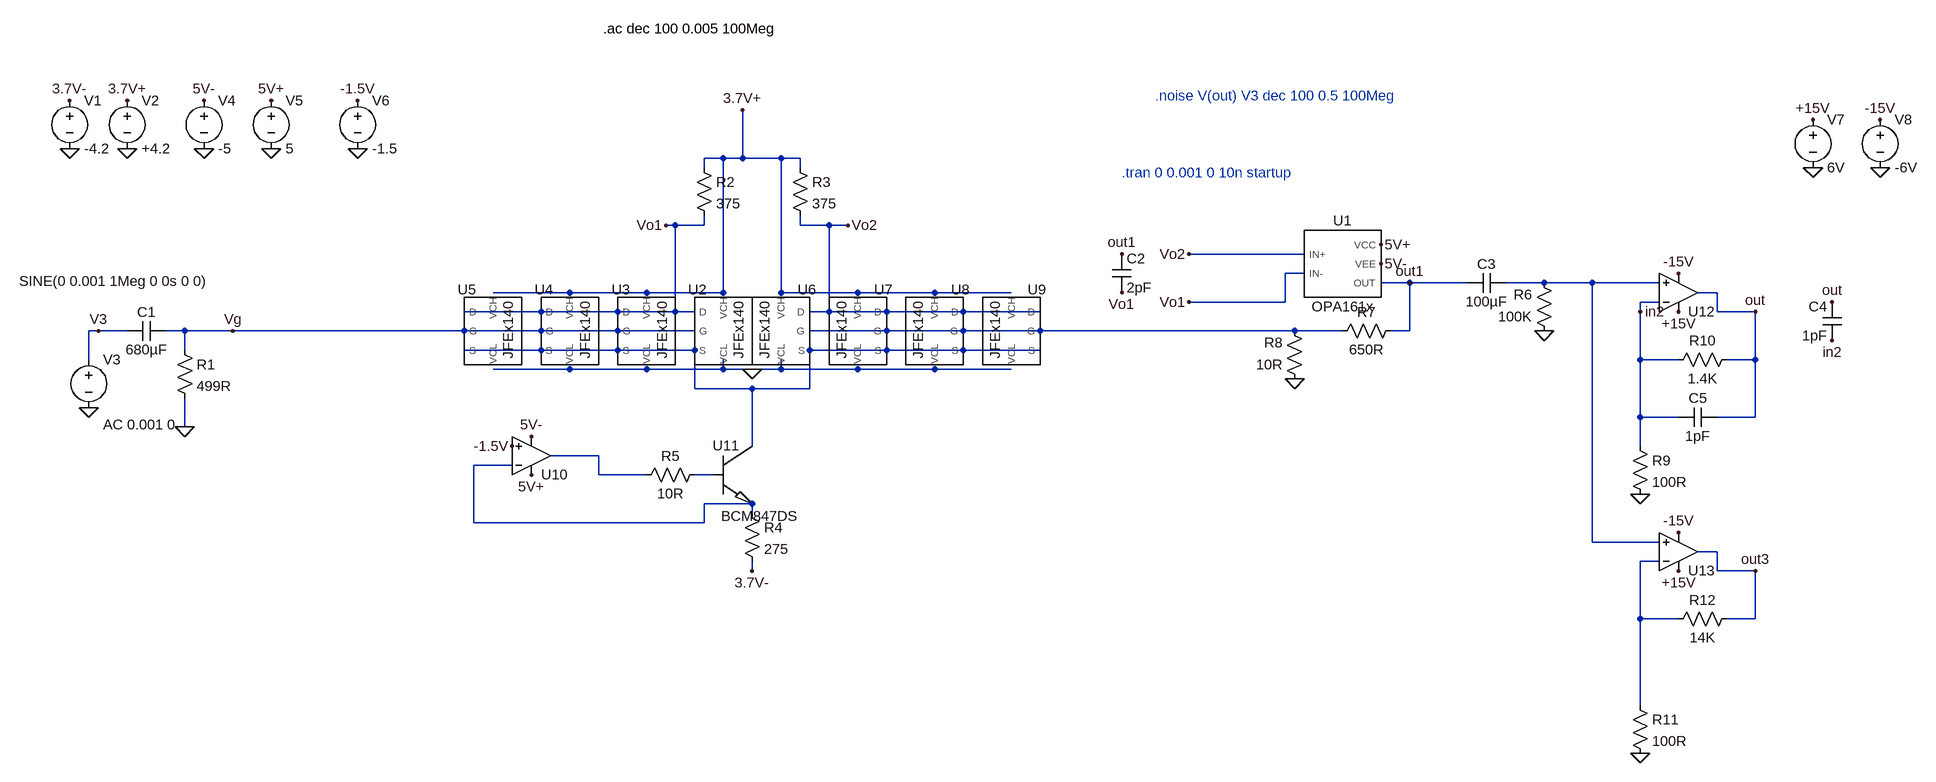
[diagram p0: schematic jfe2140_opa1612_cascode.asc]
jfe2140_opa1612_cascode.asc, the LTspice schematic file:
Version 4.1
SHEET 1 1956 964
WIRE -96 -48 -128 -48
WIRE -64 -48 -64 -128
WIRE -64 -48 -96 -48
WIRE 0 -48 -64 -48
WIRE 32 -48 0 -48
WIRE -128 -32 -128 -48
WIRE 32 -32 32 -48
WIRE -176 64 -192 64
WIRE -128 64 -128 48
WIRE -128 64 -176 64
WIRE 32 64 32 48
WIRE 80 64 32 64
WIRE 112 64 80 64
WIRE 912 112 720 112
WIRE 912 144 880 144
WIRE 1088 160 1040 160
WIRE 1184 160 1088 160
WIRE 1312 160 1248 160
WIRE 1392 160 1312 160
WIRE 1504 160 1392 160
WIRE -352 176 -480 176
WIRE -224 176 -352 176
WIRE -96 176 -96 -48
WIRE -96 176 -224 176
WIRE 0 176 0 -48
WIRE 128 176 0 176
WIRE 256 176 128 176
WIRE 384 176 256 176
WIRE 1600 176 1568 176
WIRE 880 192 880 144
WIRE 880 192 720 192
WIRE 1504 192 1472 192
WIRE -400 208 -528 208
WIRE -272 208 -400 208
WIRE -176 208 -176 64
WIRE -176 208 -272 208
WIRE -144 208 -176 208
WIRE 80 208 80 64
WIRE 80 208 48 208
WIRE 176 208 80 208
WIRE 304 208 176 208
WIRE 432 208 304 208
WIRE 1472 208 1472 192
WIRE 1600 208 1600 176
WIRE 1664 208 1600 208
WIRE -1216 240 -1232 240
WIRE -1168 240 -1216 240
WIRE -1072 240 -1104 240
WIRE -992 240 -1072 240
WIRE -528 240 -992 240
WIRE -400 240 -528 240
WIRE -272 240 -400 240
WIRE -144 240 -272 240
WIRE 176 240 48 240
WIRE 304 240 176 240
WIRE 432 240 304 240
WIRE 896 240 432 240
WIRE 976 240 896 240
WIRE 1088 240 1088 160
WIRE 1088 240 1056 240
WIRE -1072 272 -1072 240
WIRE -400 272 -528 272
WIRE -272 272 -400 272
WIRE -144 272 -272 272
WIRE 176 272 48 272
WIRE 304 272 176 272
WIRE 432 272 304 272
WIRE -1232 288 -1232 240
WIRE 1472 288 1472 208
WIRE 1536 288 1472 288
WIRE 1664 288 1664 208
WIRE 1664 288 1616 288
WIRE -352 304 -480 304
WIRE -224 304 -352 304
WIRE -96 304 -96 288
WIRE -96 304 -224 304
WIRE -48 304 -96 304
WIRE 0 304 0 288
WIRE 0 304 -48 304
WIRE 128 304 0 304
WIRE 256 304 128 304
WIRE 384 304 256 304
WIRE -144 336 -144 272
WIRE -48 336 -144 336
WIRE 48 336 48 272
WIRE 48 336 -48 336
WIRE 1472 384 1472 288
WIRE 1536 384 1472 384
WIRE 1664 384 1664 288
WIRE 1664 384 1600 384
WIRE -1072 400 -1072 352
WIRE -48 432 -48 336
WIRE 1472 432 1472 384
WIRE -304 448 -384 448
WIRE -448 464 -512 464
WIRE -304 480 -304 448
WIRE -224 480 -304 480
WIRE -112 480 -144 480
WIRE -48 528 -128 528
WIRE -48 544 -48 528
WIRE -512 560 -512 464
WIRE -128 560 -128 528
WIRE -128 560 -512 560
WIRE 1392 592 1392 160
WIRE 1504 592 1392 592
WIRE 1600 608 1568 608
WIRE 1504 624 1472 624
WIRE -48 640 -48 624
WIRE 1600 640 1600 608
WIRE 1664 640 1600 640
WIRE 1472 720 1472 624
WIRE 1536 720 1472 720
WIRE 1664 720 1664 640
WIRE 1664 720 1616 720
WIRE 1472 864 1472 720
FLAG -1264 -64 0
FLAG -1168 -64 0
FLAG -1168 -144 3.7V+
FLAG -1264 -144 3.7V-
FLAG -64 -128 3.7V+
FLAG -1072 400 0
FLAG -1232 368 0
FLAG -48 640 3.7V-
FLAG -1216 240 V3
FLAG -992 240 Vg
FLAG 112 64 Vo2
FLAG -1040 -64 0
FLAG -928 -64 0
FLAG -1040 -144 5V-
FLAG -928 -144 5V+
FLAG 1040 96 5V+
FLAG 1040 128 5V-
FLAG -192 64 Vo1
FLAG 1088 160 out1
FLAG 896 320 0
FLAG 720 112 Vo2
FLAG 720 192 Vo1
FLAG -784 -64 0
FLAG -784 -144 -1.5V
FLAG -48 304 0
FLAG 608 112 out1
FLAG 608 176 Vo1
FLAG -416 480 5V+
FLAG -416 416 5V-
FLAG -448 432 -1.5V
FLAG 1312 240 0
FLAG 1472 512 0
FLAG 1760 -112 +15V
FLAG 1760 -32 0
FLAG 1872 -112 -15V
FLAG 1872 -32 0
FLAG 1536 208 +15V
FLAG 1536 144 -15V
FLAG 1664 208 out
FLAG 1792 192 out
FLAG 1792 256 in2
FLAG 1472 208 in2
FLAG 1472 944 0
FLAG 1536 640 +15V
FLAG 1536 576 -15V
FLAG 1664 640 out3
SYMBOL voltage -1264 -160 R0
WINDOW 123 0 0 Left 0
WINDOW 39 0 0 Left 0
SYMATTR InstName V1
SYMATTR Value -4.2
SYMBOL cap -1104 224 R90
WINDOW 0 0 32 VBottom 2
WINDOW 3 32 32 VTop 2
SYMATTR InstName C1
SYMATTR Value 680µF
SYMBOL res -1088 256 R0
SYMATTR InstName R1
SYMATTR Value 499R
SYMBOL voltage -1232 272 R0
WINDOW 123 24 124 Left 2
WINDOW 39 0 0 Left 0
WINDOW 3 -116 -115 Left 2
SYMATTR Value2 AC 0.001 0
SYMATTR Value SINE(0 0.001 1Meg 0 0s 0 0)
SYMATTR InstName V3
SYMBOL res -144 -48 R0
SYMATTR InstName R2
SYMATTR Value 375
SYMATTR SpiceLine tol=0.2
SYMBOL res 16 -48 R0
SYMATTR InstName R3
SYMATTR Value 375
SYMATTR SpiceLine tol=0.2
SYMBOL voltage -1040 -160 R0
WINDOW 123 0 0 Left 0
WINDOW 39 0 0 Left 0
SYMATTR InstName V4
SYMATTR Value -5
SYMBOL voltage -928 -160 R0
WINDOW 123 0 0 Left 0
WINDOW 39 0 0 Left 0
SYMATTR InstName V5
SYMATTR Value 5
SYMBOL voltage -1168 -160 R0
WINDOW 123 0 0 Left 0
WINDOW 39 0 0 Left 0
SYMATTR InstName V2
SYMATTR Value +4.2
SYMBOL res 1072 224 R90
WINDOW 0 0 56 VBottom 2
WINDOW 3 32 56 VTop 2
SYMATTR InstName R7
SYMATTR Value 650R
SYMBOL res 912 336 R180
WINDOW 0 36 76 Left 2
WINDOW 3 36 40 Left 2
SYMATTR InstName R8
SYMATTR Value 10R
SYMBOL voltage -784 -160 R0
WINDOW 123 0 0 Left 0
WINDOW 39 0 0 Left 0
SYMATTR InstName V6
SYMATTR Value -1.5
SYMBOL JFEx140 -96 240 R0
SYMATTR InstName U2
SYMBOL JFEx140 -224 240 R0
SYMATTR InstName U3
SYMBOL JFEx140 -352 240 R0
SYMATTR InstName U4
SYMBOL JFEx140 -480 240 R0
SYMATTR InstName U5
SYMBOL JFEx140 0 240 M0
SYMATTR InstName U6
SYMBOL JFEx140 128 240 M0
SYMATTR InstName U7
SYMBOL JFEx140 256 240 M0
SYMATTR InstName U8
SYMBOL JFEx140 384 240 M0
SYMATTR InstName U9
SYMBOL OPA161x 976 128 R0
SYMATTR InstName U1
SYMBOL cap 592 112 R0
SYMATTR InstName C2
SYMATTR Value 2pF
SYMBOL res -64 528 R0
SYMATTR InstName R4
SYMATTR Value 275
SYMBOL res -128 464 R90
WINDOW 0 0 56 VBottom 2
WINDOW 3 32 56 VTop 2
SYMATTR InstName R5
SYMATTR Value 10R
SYMBOL OpAmps\\UniversalOpAmp -416 448 M180
SYMATTR InstName U10
SYMBOL BCM847DS -112 432 R0
WINDOW 0 -2 -1 Left 2
WINDOW 3 12 117 Left 2
SYMATTR InstName U11
SYMBOL cap 1248 144 R90
WINDOW 0 0 32 VBottom 2
WINDOW 3 32 32 VTop 2
SYMATTR InstName C3
SYMATTR Value 100µF
SYMBOL res 1328 256 R180
WINDOW 0 36 76 Left 2
WINDOW 3 36 40 Left 2
SYMATTR InstName R6
SYMATTR Value 100K
SYMBOL res 1456 416 R0
SYMATTR InstName R9
SYMATTR Value 100R
SYMBOL res 1632 272 R90
WINDOW 0 0 56 VBottom 2
WINDOW 3 32 56 VTop 2
SYMATTR InstName R10
SYMATTR Value 1.4K
SYMBOL voltage 1760 -128 R0
WINDOW 123 0 0 Left 0
WINDOW 39 0 0 Left 0
SYMATTR InstName V7
SYMATTR Value 6V
SYMBOL voltage 1872 -128 R0
WINDOW 123 0 0 Left 0
WINDOW 39 0 0 Left 0
SYMATTR InstName V8
SYMATTR Value -6V
SYMBOL cap 1808 256 R180
WINDOW 0 24 56 Left 2
WINDOW 3 24 8 Left 2
SYMATTR InstName C4
SYMATTR Value 1pF
SYMBOL cap 1600 368 R90
WINDOW 0 0 32 VBottom 2
WINDOW 3 32 32 VTop 2
SYMATTR InstName C5
SYMATTR Value 1pF
SYMBOL OpAmps\\UniversalOpAmp 1536 176 M180
SYMATTR InstName U12
SYMATTR Value2 Avol=1Meg GBW=500Meg Vos=0
SYMBOL res 1456 848 R0
SYMATTR InstName R11
SYMATTR Value 100R
SYMBOL res 1632 704 R90
WINDOW 0 0 56 VBottom 2
WINDOW 3 32 56 VTop 2
SYMATTR InstName R12
SYMATTR Value 14K
SYMBOL OpAmps\\UniversalOpAmp 1536 608 M180
SYMATTR InstName U13
SYMATTR Value2 Avol=1Meg GBW=500Meg Vos=0
TEXT -296 -264 Left 2 !.ac dec 100 0.005 100Meg
TEXT 608 -24 Left 2 ;.tran 0 0.001 0 10n startup
TEXT 664 -152 Left 2 ;.noise V(out) V3 dec 100 0.5 100Meg

The netlist it stands for:
* jfe2140_opa1612_cascode.asc
V1 3.7V- 0 -4.2
C1 Vg V3 680µF
R1 Vg 0 499R
V3 V3 0 SINE(0 0.001 1Meg 0 0s 0 0) AC 0.001 0
R2 3.7V+ Vo1 375 tol=0.2
R3 3.7V+ Vo2 375 tol=0.2
V4 5V- 0 -5
V5 5V+ 0 5
V2 3.7V+ 0 +4.2
R7 out1 N002 650R
R8 0 N002 10R
V6 -1.5V 0 -1.5
X§U2 Vo1 Vg N003 3.7V+ 0 JFEx140  ; pins D G S VCH VCL
X§U3 Vo1 Vg N003 3.7V+ 0 JFEx140  ; pins D G S VCH VCL
X§U4 Vo1 Vg N003 3.7V+ 0 JFEx140  ; pins D G S VCH VCL
X§U5 Vo1 Vg N003 3.7V+ 0 JFEx140  ; pins D G S VCH VCL
X§U6 Vo2 N002 N003 3.7V+ 0 JFEx140  ; pins D G S VCH VCL
X§U7 Vo2 N002 N003 3.7V+ 0 JFEx140  ; pins D G S VCH VCL
X§U8 Vo2 N002 N003 3.7V+ 0 JFEx140  ; pins D G S VCH VCL
X§U9 Vo2 N002 N003 3.7V+ 0 JFEx140  ; pins D G S VCH VCL
X§U1 Vo2 Vo1 5V+ 5V- out1 OPA161x  ; pins IN+ IN- VCC VEE OUT
C2 out1 Vo1 2pF
R4 N005 3.7V- 275
R5 N006 N004 10R
X§U10 -1.5V N005 5V+ 5V- N004 level1 Avol=1Meg GBW=10Meg Vos=0 En=0 Enk=0 In=0 Ink=0 Rin=500Meg  ; pins In+ In- V+ V- OUT
X§U11 N003 N006 N005 BCM847DS  ; pins C B E
C3 N001 out1 100µF
R6 0 N001 100K
R9 in2 0 100R
R10 out in2 1.4K
V7 +15V 0 6V
V8 -15V 0 -6V
C4 in2 out 1pF
C5 out in2 1pF
X§U12 N001 in2 +15V -15V out level1 Avol=1Meg GBW=500Meg Vos=0 En=0 Enk=0 In=0 Ink=0 Rin=500Meg  ; pins In+ In- V+ V- OUT
R11 N007 0 100R
R12 out3 N007 14K
X§U13 N001 N007 +15V -15V out3 level1 Avol=1Meg GBW=500Meg Vos=0 En=0 Enk=0 In=0 Ink=0 Rin=500Meg  ; pins In+ In- V+ V- OUT
.ac dec 100 0.005 100Meg
* .tran 0 0.001 0 10n startup
* .noise V(out) V3 dec 100 0.5 100Meg
.lib jfex140.lib
.lib OPA161x.LIB
.lib UniversalOpAmp1.lib
.lib BCM847.lib
.backanno
.end